# Altium project FG23_diff_PA_match.PrjPcb
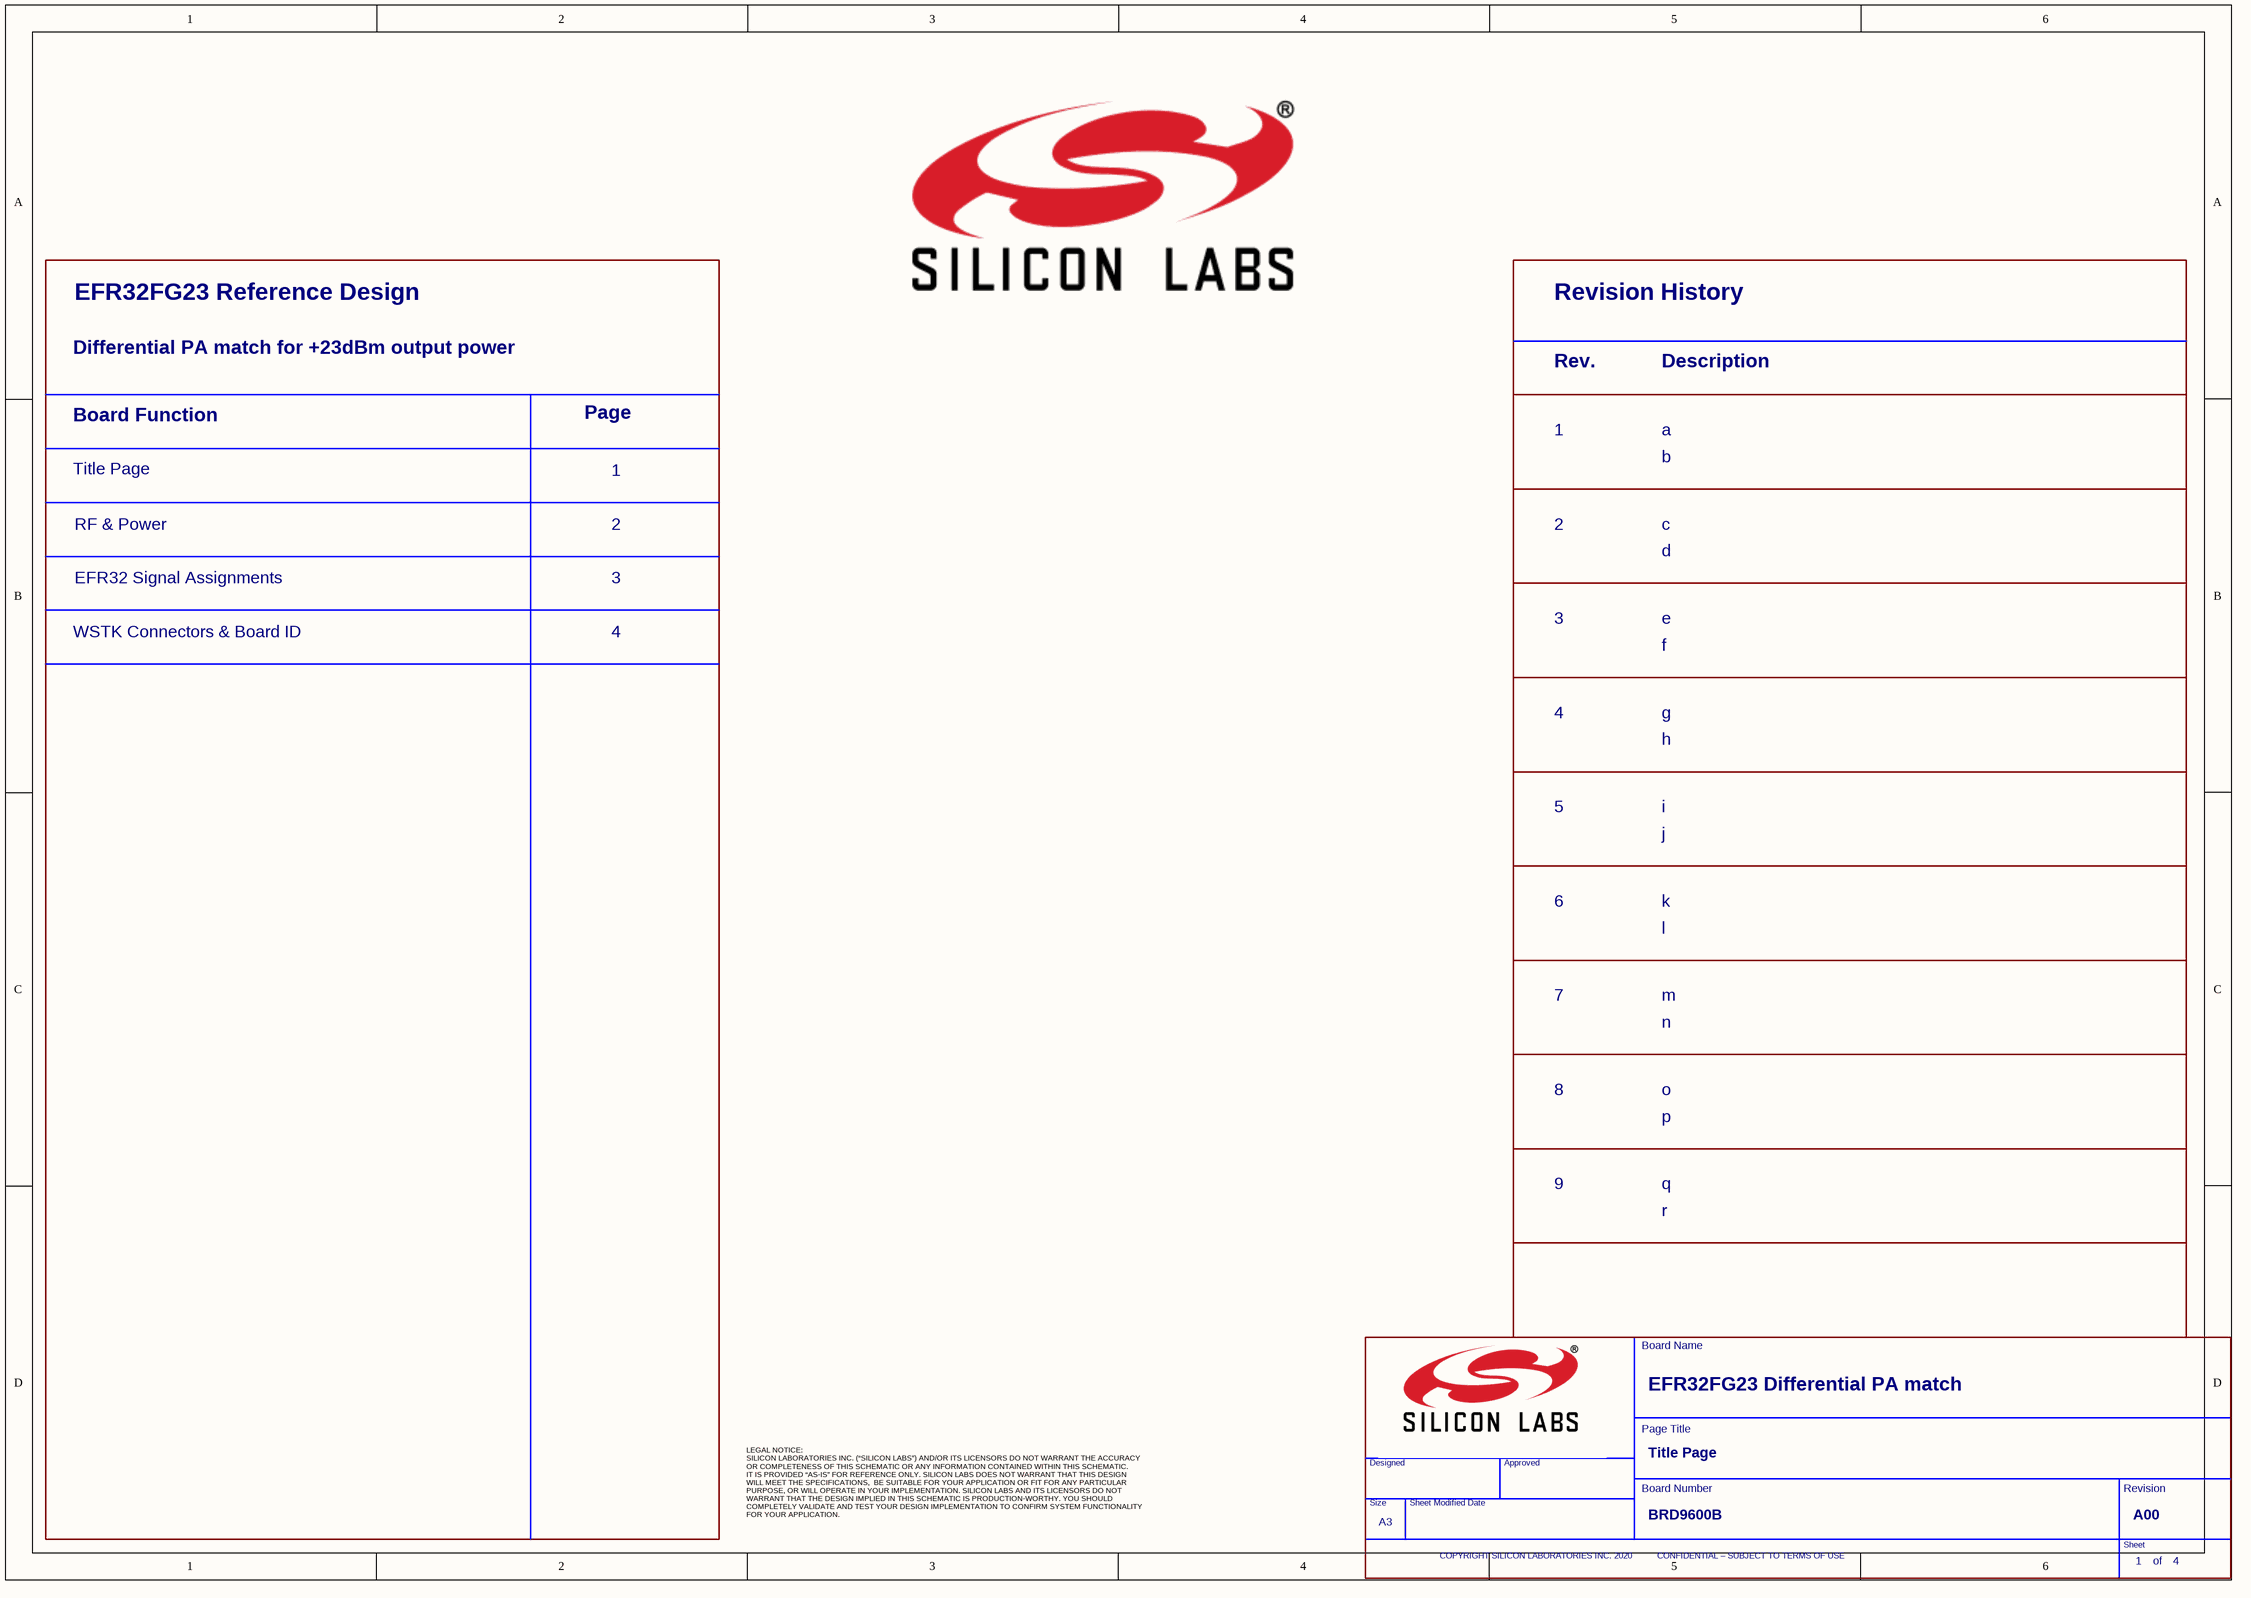
[diagram p0: FG23_diff_PA_match_SCH_Title.SchDoc]
4 sheets, 90 parts. Net scope: global (net labels, ports and power ports of the same name join across sheets).
Board files: FG23_diff_PA_match_PCB.PcbDoc, Ocelot_Test_panel.PcbDoc
Sheets:
  FG23_diff_PA_match_SCH_Title.SchDoc
  FG23_diff_PA_match_SCH_RF_Power.SchDoc
  FG23_diff_PA_match_SCH_Signal_Assign.SchDoc
  FG23_diff_PA_match_SCH_WSTK_Connectors.SchDoc

## Sheet FG23_diff_PA_match_SCH_Title.SchDoc
size 420 x 297 mm

### Parts
(Parts that share a designator on the sheet are numbered #1, #2 ... from top to bottom, then left to right.)
*#1  Header A: EFR32FG23 Reference Design  Header B: Differential PA match for +23dBm output power  (hidden comment: Toc_Header)  (graphical)
*#2  Dscr4B: h  Dscr5B: j  Dscr4A: g  Dscr6B: l  Dscr5A: i  Dscr7B: n  Dscr6A: k  Dscr8B: p  Dscr7A: m  Dscr9B: r  Dscr8A: o  Dscr9A: q  Dscr1B: b  Dscr2B: d  Dscr1A: a  Dscr3B: f  Dscr2A: c  Dscr3A: e  Rev9: 9  Rev8: 8  Rev7: 7  Rev6: 6  Rev5: 5  Rev4: 4  Rev3: 3  Rev2: 2  Rev1: 1  (hidden comment: Rev_History)  (graphical)
*#3  Doc: BRD9600B  RevCode: A00  Page Title: Title Page  Page Size: A3  Page Number: 1  Page Count: 4  Title: EFR32FG23 Differential PA match  (hidden comment: TitleBlock_SiliconLabs_A3)  (graphical)

### Notes on the sheet
- Board Function
- Page
- Title Page
- RF & Power
- 1
- 2
- EFR32 Signal Assignments
- 3
- WSTK Connectors & Board ID
- 4
- LEGAL NOTICE:
  SILICON LABORATORIES INC. (“SILICON LABS”) AND/OR ITS LICENSORS DO NOT WARRANT THE ACCURACY
  OR COMPLETENESS OF THIS SCHEMATIC OR ANY INFORMATION CONTAINED WITHIN THIS SCHEMATIC.
  IT IS PROVIDED “AS-IS” FOR REFERENCE ONLY. SILICON LABS DOES NOT WARRANT THAT THIS DESIGN
  WILL MEET THE SPECIFICATIONS,  BE SUITABLE FOR YOUR APPLICATION OR FIT FOR ANY PARTICULAR
  PURPOSE, OR WILL OPERATE IN YOUR IMPLEMENTATION. SILICON LABS AND ITS LICENSORS DO NOT
  WARRANT THAT THE DESIGN IMPLIED IN THIS SCHEMATIC IS PRODUCTION-WORTHY. YOU SHOULD
  COMPLETELY VALIDATE AND TEST YOUR DESIGN IMPLEMENTATION TO CONFIRM SYSTEM FUNCTIONALITY
  FOR YOUR APPLICATION.
- (in symbol Rev_History) Revision History; Rev.; Description
- (in symbol TitleBlock_SiliconLabs_A3) Board Name; Page Title; Designed; Approved; Board Number; Revision; Size; Sheet Modified Date; Sheet; COPYRIGHT SILICON LABORATORIES INC. 2020          CONFIDENTIAL – SUBJECT TO TERMS OF USE; of

### Library data of the parts
*#2 = Rev_History: RevCode: PA00*
*#3 = TitleBlock_SiliconLabs_A3: OrgName: Silicon Labs

## Sheet FG23_diff_PA_match_SCH_RF_Power.SchDoc
size 420 x 297 mm
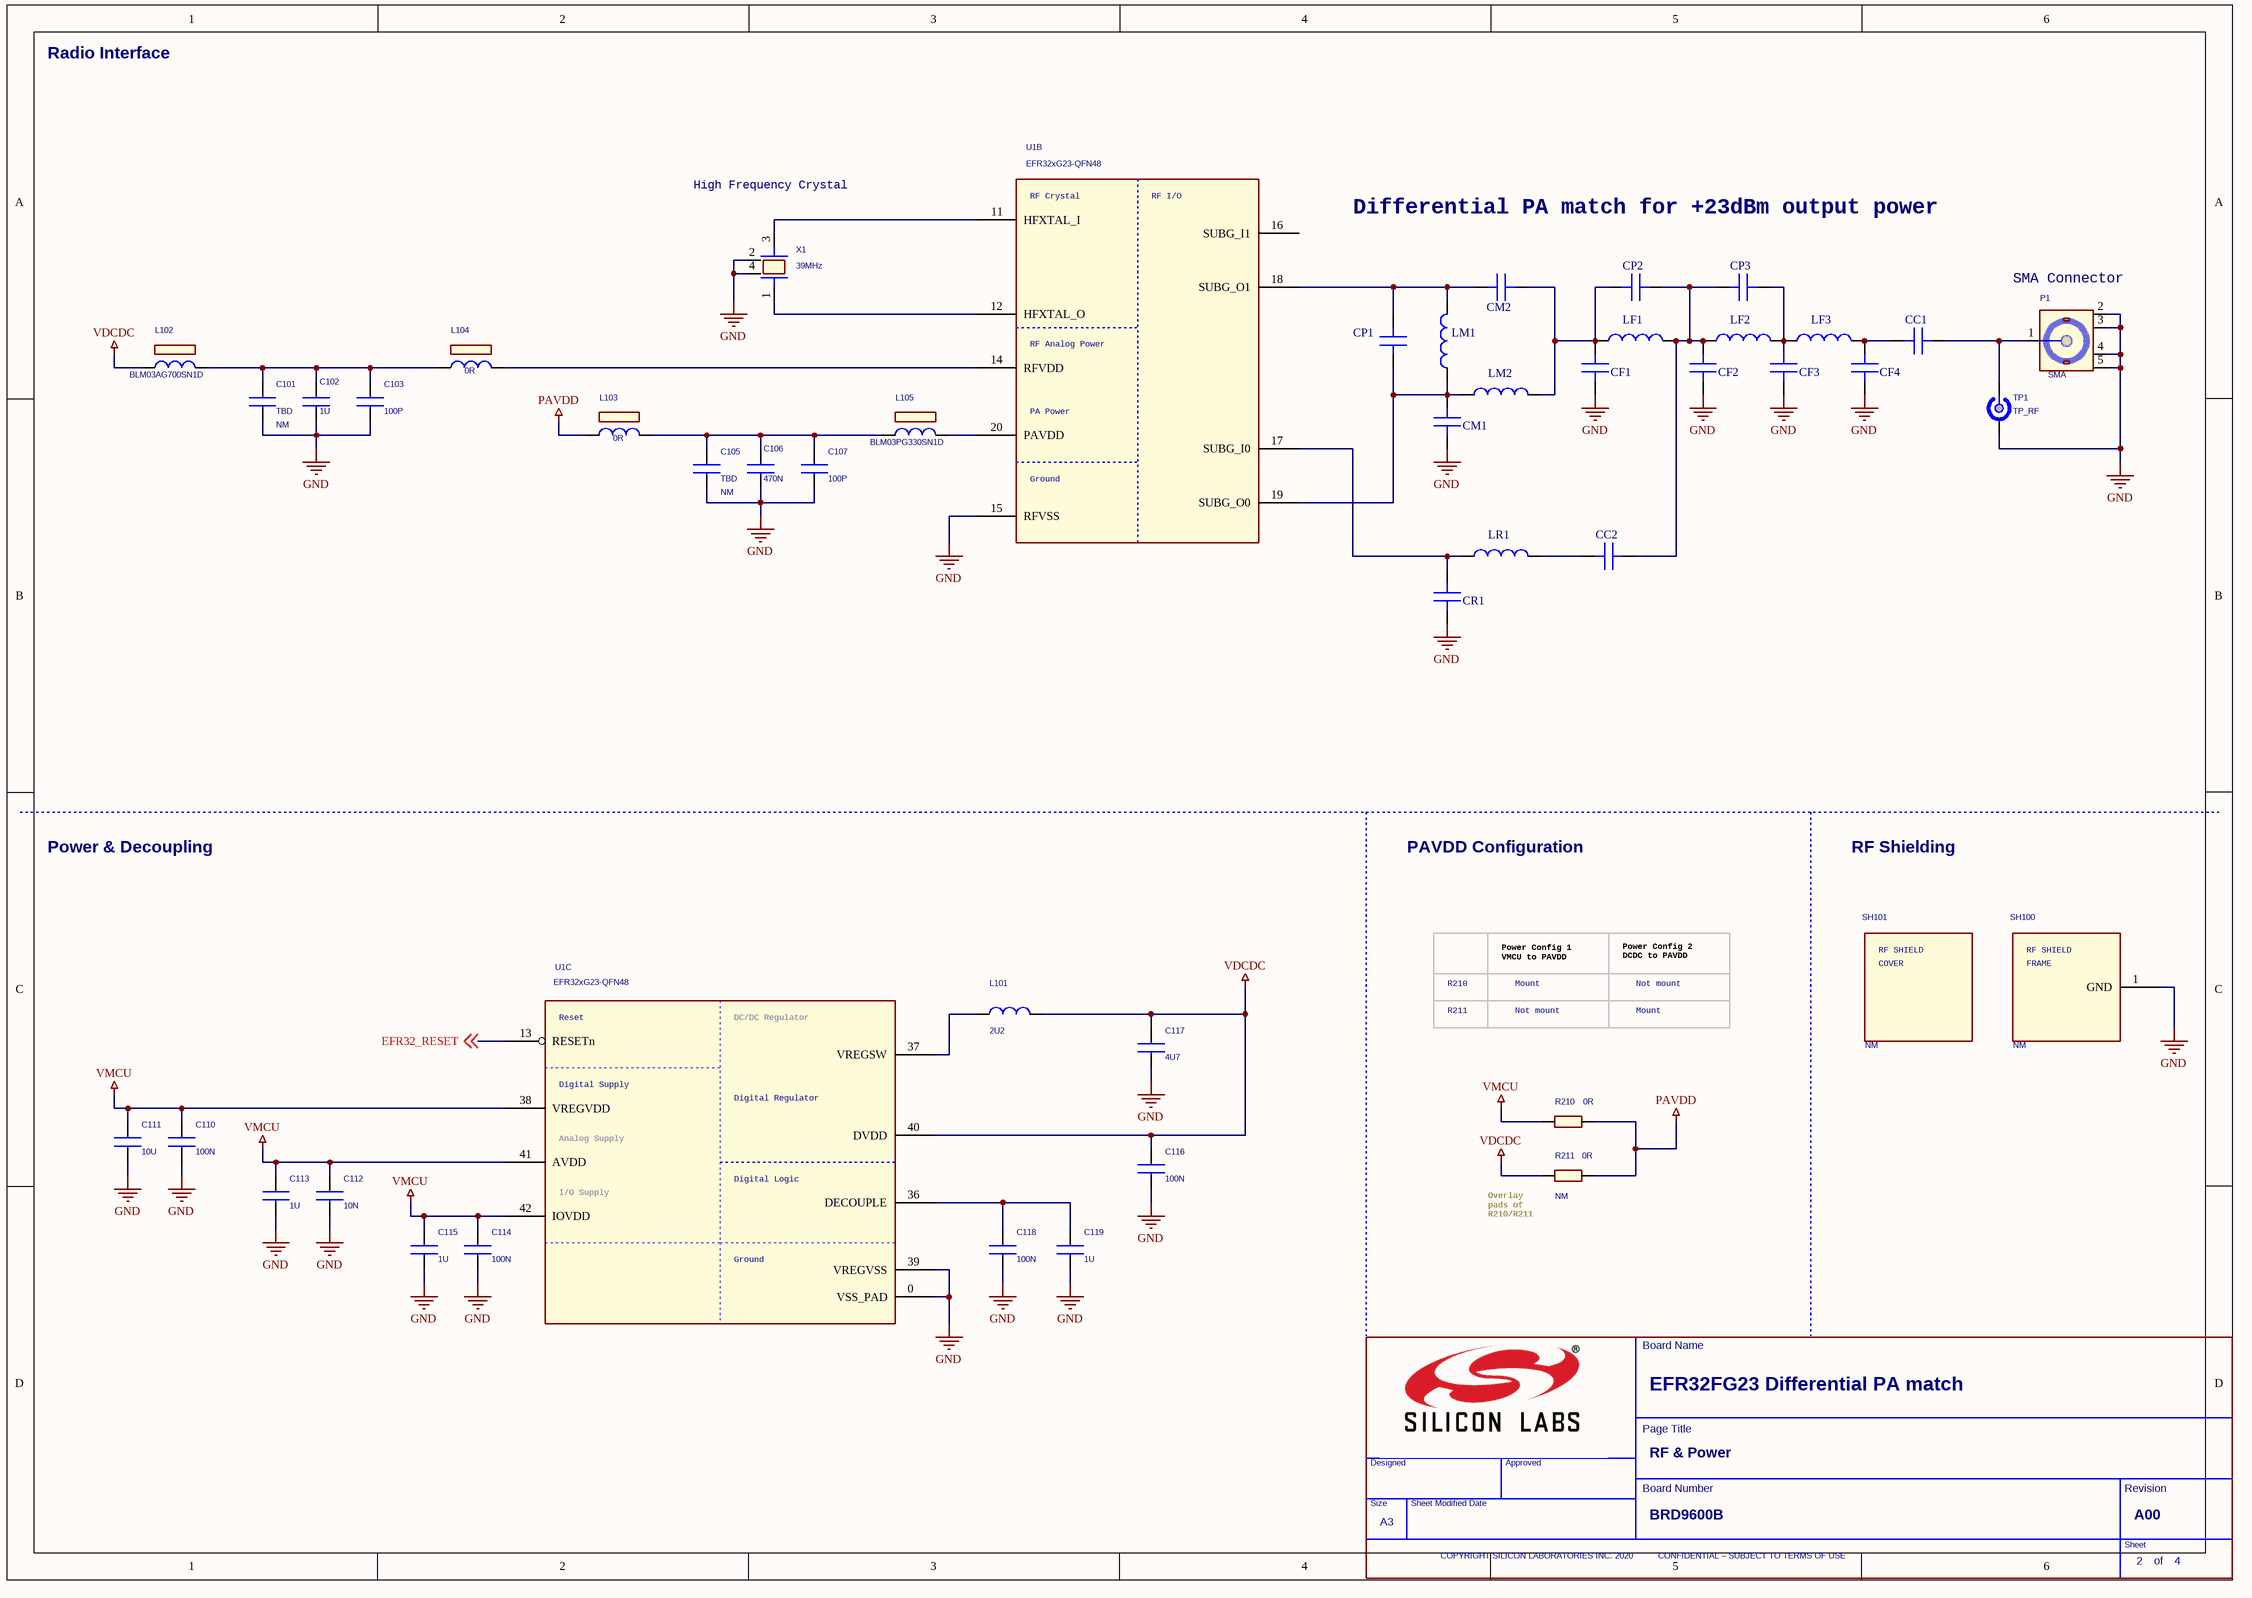
[diagram p1: FG23_diff_PA_match_SCH_RF_Power.SchDoc]

### Parts
(Parts that share a designator on the sheet are numbered #1, #2 ... from top to bottom, then left to right.)
*#4  Doc: BRD9600B  RevCode: A00  Page Title: RF & Power  Page Size: A3  Page Number: 2  Page Count: 4  Title: EFR32FG23 Differential PA match  (hidden comment: TitleBlock_SiliconLabs_A3)  (graphical)
C101  TBD  Not Mounted: NM  [C0201_L]
C102  1U  [C0402_L]
C103  100P  [C0201_L]
C105  TBD  Not Mounted: NM  [C0201_L]
C106  470N  [C0402_L]
C107  100P  [C0201_L]
C110  100N  [C0201_L]
C111  10U  [C0603_L]
C112  10N  [C0201_L]
C113  1U  [C0402_L]
C114  100N  [C0201_L]
C115  1U  [C0402_L]
C116  100N  [C0201_L]
C117  4U7  [C0603_L]
C118  100N  [C0201_L]
C119  1U  [C0402_L]
CC1  (no value)  [C0201_GM]
CC2  (no value)  [C0201_GM]
CF1  (no value)  [C0201_GM]
CF2  (no value)  [C0201_GM]
CF3  (no value)  [C0201_GM]
CF4  (no value)  [C0201_GM]
CM1  (no value)  [C0201_GM]
CM2  (no value)  [C0201_GM]
CP1  (no value)  [C0201_GM]
CP2  (no value)  [C0201_GM]
CP3  (no value)  [C0201_GM]
CR1  (no value)  [C0201_GM]
L101  2U2  [COIL_1008_L]
L102  BLM03AG700SN1D  [COIL_MUR_BLM03_0201]
L103  0R  [COIL_MUR_BLM03_0201]
L104  0R  [COIL_MUR_BLM03_0201]
L105  BLM03PG330SN1D  [COIL_MUR_BLM03_0201]
LF1  LQP03HQ3N6B02  [COIL_0201_GM]  (value not drawn)
LF2  LQP03HQ3N6B02  [COIL_0201_GM]  (value not drawn)
LF3  LQP03HQ3N6B02  [COIL_0201_GM]  (value not drawn)
LM1  LQP03HQ3N6B02  [COIL_0201_GM]  (value not drawn)
LM2  LQP03HQ3N6B02  [COIL_0201_GM]  (value not drawn)
LR1  LQP03HQ3N6B02  [COIL_0201_GM]  (value not drawn)
P1  SMA  [TE_SMA_1814832_TH_VER]
R210  0R  [R0402_L]
R211  0R  Not Mounted: NM  [R0402_L]
SH100  Not Mounted: NM  [Shield_21x21mm]  (hidden comment: RF_SHIELD_FRAME_36103205S)
SH101  Not Mounted: NM  (hidden comment: RF_SHIELD_COVER_36003200S)
TP1  TP_RF  [TP_INGUN_50OHM_PARTIAL]
U1  EFR32xG23-QFN48  [QFN48_M040_6.0X6.0_EP_SL]  (parts B,C of 3)
X1  39MHz  [X_SSS_DSX211SH_2.05X1.65-4]

### Nets
GND: C101.2 C102.2 C103.2 C105.2 C106.2 C107.2 C110.2 C111.2 C112.2 C113.2 C114.2 C115.2 C116.2 C117.2 C118.2 C119.2 CF1.1 CF2.1 CF3.1 CF4.1 CM1.1 CR1.1 P1.2(GND1) P1.3(GND2) P1.4(GND3) P1.5(GND4) SH100.1(GND) TP1.2(GND) U1.0(VSS_PAD) U1.15(RFVSS) U1.39(VREGVSS) X1.2 X1.4
PAVDD: L103.1 R210.1 R211.2
VDCDC: C116.1 C117.1 L101.2 L102.1 R211.1 U1.40(DVDD)
VMCU: C110.1 C111.1 C112.1 C113.1 C114.1 C115.1 R210.2 U1.38(VREGVDD) U1.41(AVDD) U1.42(IOVDD)
EFR32_RESET: U1.13(RESETn) ; off-sheet EFR32_RESET  [project net DBG_RESET]
NetC101_1: C101.1 C102.1 C103.1 L102.2 L104.1
NetC105_1: C105.1 C106.1 C107.1 L103.2 L105.1
NetC118_1: C118.1 C119.1 U1.36(DECOUPLE)
NetCC1_1: CC1.1 CF4.2 LF3.2
NetCC1_2: CC1.2 P1.1(SIGNAL) TP1.1(RF)
NetCC2_1: CC2.1 LR1.2
NetCC2_2: CC2.2 CF2.2 CP2.2 CP3.1 LF1.2 LF2.1
NetCF1_2: CF1.2 CM2.2 CP2.1 LF1.1 LM2.2
NetCF3_2: CF3.2 CP3.2 LF2.2 LF3.1
NetCM1_2: CM1.2 CP1.1 LM1.1 LM2.1 U1.19(SUBG_O0)
NetCM2_1: CM2.1 CP1.2 LM1.2 U1.18(SUBG_O1)
NetCR1_2: CR1.2 LR1.1 U1.17(SUBG_I0)
NetL101_1: L101.1 U1.37(VREGSW)
NetL104_2: L104.2 U1.14(RFVDD)
NetL105_2: L105.2 U1.20(PAVDD)
NetU1_11: U1.11(HFXTAL_I) X1.3
NetU1_12: U1.12(HFXTAL_O) X1.1

Not connected (* = marked no-connect by the designer): U1 16(SUBG_I1)

### Notes on the sheet
- Radio Interface
- High Frequency Crystal
- Differential PA match for +23dBm output power
- (near P1) SMA Connector
- Power & Decoupling
- PAVDD Configuration
- RF Shielding
- R210
- Power Config 1
  VMCU to PAVDD
- Mount
- Power Config 2
  DCDC to PAVDD
- Not mount
- R211
- (near R211) Overlay
  pads of
  R210/R211
- (in symbol EFR32xG23_QFN48, part B) RF Crystal; RF I/O; RF Analog Power; PA Power; Ground
- (in symbol EFR32xG23_QFN48, part C) Reset; DC/DC Regulator; Digital Supply; Digital Regulator; Analog Supply; Digital Logic; I/O Supply; Ground
- (in symbol RF_SHIELD_COVER_36003200S) RF SHIELD; COVER
- (in symbol RF_SHIELD_FRAME_36103205S) RF SHIELD; FRAME
- (in symbol TitleBlock_SiliconLabs_A3) Board Name; Page Title; Designed; Approved; Board Number; Revision; Size; Sheet Modified Date; Sheet; COPYRIGHT SILICON LABORATORIES INC. 2020          CONFIDENTIAL – SUBJECT TO TERMS OF USE; of

### Library data of the parts
C101 C105 = C0201: Tolerance: +/-0.05P; Rating: 50V; Technology: C0G
C102 C113 C115 C119 = C0402: Tolerance: 10%; Rating: 6.3V; Technology: X7R
C103 C107 = C0201: Tolerance: 5%; Rating: 25V; Technology: C0G
C106 = C0402: Tolerance: 10%; Rating: 10V; Technology: X7R
C110 C114 C116 C118 = C0201: Tolerance: 20%; Rating: 16V; Technology: X7S
C111 = C0603: Tolerance: 10%; Rating: 25V; Technology: X5R
C112 = C0201: Tolerance: 10%; Rating: 16V; Technology: X7S
C117 = C0603: Tolerance: 10%; Rating: 6.3V; Technology: X7R
CC1 CC2 = CMP-120-00593-A.01: CAP CER 0201 C0G 50V ±0.1pF; Manufacturer: Murata; Manufacturer PN: GJM0335C1H7R1BB01; Value: 220; SubCategory Tag: Ceramic; Min Operating Temp: -55°C; RoHS: Compliant; Material: C0G; Package: 0201; Tolerance: 0.1pF; Max Operating Temp: 125°C; Mount: SMD; Rating: 50V
CF1 CF4 = CMP-120-00593-A.01: CAP CER 0201 C0G 50V ±0.1pF; Manufacturer: Murata; Manufacturer PN: GJM0335C1H7R1BB01; Value: 15; SubCategory Tag: Ceramic; Min Operating Temp: -55°C; RoHS: Compliant; Material: C0G; Package: 0201; Tolerance: 0.1pF; Max Operating Temp: 125°C; Mount: SMD; Rating: 50V
CF2 CF3 = CMP-120-00593-A.01: CAP CER 0201 C0G 50V ±0.1pF; Manufacturer: Murata; Manufacturer PN: GJM0335C1H7R1BB01; Value: 30; SubCategory Tag: Ceramic; Min Operating Temp: -55°C; RoHS: Compliant; Material: C0G; Package: 0201; Tolerance: 0.1pF; Max Operating Temp: 125°C; Mount: SMD; Rating: 50V
CM1 = CMP-120-00593-A.01: CAP CER 0201 C0G 50V ±0.1pF; Manufacturer: Murata; Manufacturer PN: GJM0335C1H7R1BB01; Value: 82; SubCategory Tag: Ceramic; Min Operating Temp: -55°C; RoHS: Compliant; Material: C0G; Package: 0201; Tolerance: 0.1pF; Max Operating Temp: 125°C; Mount: SMD; Rating: 50V
CM2 = CMP-120-00593-A.01: CAP CER 0201 C0G 50V ±0.1pF; Manufacturer: Murata; Manufacturer PN: GJM0335C1H7R1BB01; Value: 43; SubCategory Tag: Ceramic; Min Operating Temp: -55°C; RoHS: Compliant; Material: C0G; Package: 0201; Tolerance: 0.1pF; Max Operating Temp: 125°C; Mount: SMD; Rating: 50V
CP1 = CMP-120-00593-A.01: CAP CER 0201 C0G 50V ±0.1pF; Manufacturer: Murata; Manufacturer PN: GJM0335C1H7R1BB01; Value: 27; SubCategory Tag: Ceramic; Min Operating Temp: -55°C; RoHS: Compliant; Material: C0G; Package: 0201; Tolerance: 0.1pF; Max Operating Temp: 125°C; Mount: SMD; Rating: 50V
CP2 CP3 = CMP-120-00593-A.01: CAP CER 0201 C0G 50V ±0.1pF; Manufacturer: Murata; Manufacturer PN: GJM0335C1H7R1BB01; Value: N.M.; SubCategory Tag: Ceramic; Min Operating Temp: -55°C; RoHS: Compliant; Material: C0G; Package: 0201; Tolerance: 0.1pF; Max Operating Temp: 125°C; Mount: SMD; Rating: 50V
CR1 = CMP-120-00593-A.01: CAP CER 0201 C0G 50V ±0.1pF; Manufacturer: Murata; Manufacturer PN: GJM0335C1H7R1BB01; Value: 2.6; SubCategory Tag: Ceramic; Min Operating Temp: -55°C; RoHS: Compliant; Material: C0G; Package: 0201; Tolerance: 0.1pF; Max Operating Temp: 125°C; Mount: SMD; Rating: 50V
L101 = L1008: Tolerance: +/-20%; Mfg #: DFE2HCAH2R2MJ0L; Mfg: Murata
L102 L105 = BLM03AX: Mfg: Murata; Price_1K: 0.05
  L102: Mfg #: BLM03AG700SN1D
  L105: Mfg #: BLM03PG330SN1D
L103 L104 = BLM03AX: Price_1K: 0.05
LF1 LF2 = CMP-155-00127-A.01: IND Fixed 0201 500mA 170mOhm ±0.1nH; Manufacturer: Murata; Value: 56; Shielding: Not shielded; DC Resistance: 0.17; Min Operating Temp: -55°C; Max Operating Temp: 125°C; Manufacturer PN: LQP03HQ3N6B02; RoHS: Compliant; SubCategory Tag: Fixed; Mount: SMD; Package: 0201; Tolerance: 0.1nH; Rating: 500mA
LF3 = CMP-155-00127-A.01: IND Fixed 0201 500mA 170mOhm ±0.1nH; Manufacturer: Murata; Value: 43; Shielding: Not shielded; DC Resistance: 0.17; Min Operating Temp: -55°C; Max Operating Temp: 125°C; Manufacturer PN: LQP03HQ3N6B02; RoHS: Compliant; SubCategory Tag: Fixed; Mount: SMD; Package: 0201; Tolerance: 0.1nH; Rating: 500mA
LM1 = CMP-155-00127-A.01: IND Fixed 0201 500mA 170mOhm ±0.1nH; Manufacturer: Murata; Value: 36; Shielding: Not shielded; DC Resistance: 0.17; Min Operating Temp: -55°C; Max Operating Temp: 125°C; Manufacturer PN: LQP03HQ3N6B02; RoHS: Compliant; SubCategory Tag: Fixed; Mount: SMD; Package: 0201; Tolerance: 0.1nH; Rating: 500mA
LM2 = CMP-155-00127-A.01: IND Fixed 0201 500mA 170mOhm ±0.1nH; Manufacturer: Murata; Value: 20; Shielding: Not shielded; DC Resistance: 0.17; Min Operating Temp: -55°C; Max Operating Temp: 125°C; Manufacturer PN: LQP03HQ3N6B02; RoHS: Compliant; SubCategory Tag: Fixed; Mount: SMD; Package: 0201; Tolerance: 0.1nH; Rating: 500mA
LR1 = CMP-155-00127-A.01: IND Fixed 0201 500mA 170mOhm ±0.1nH; Manufacturer: Murata; Value: 220; Shielding: Not shielded; DC Resistance: 0.17; Min Operating Temp: -55°C; Max Operating Temp: 125°C; Manufacturer PN: LQP03HQ3N6B02; RoHS: Compliant; SubCategory Tag: Fixed; Mount: SMD; Package: 0201; Tolerance: 0.1nH; Rating: 500mA
P1 = SMA_TH_WELLSHOW: Mfg #: C02AN31P00101; Price_1K: 1.46; Mfg: Wellshow
R210 R211 = R0402: Price_1K: 0.005
SH100 = RF_SHIELD_FRAME_36103205S: Mfg: Würth Elektronik; Mfg #: 36103205S; Price_1k: 1.00
SH101 = RF_SHIELD_COVER_36003200S: Mfg: Würth Elektronik; Mfg #: 36003200S; Price_1k: 0.944
U1 = EFR32xG23_QFN48: MFG: Silicon Labs; MFG #: EFR32xG23-QFN48
X1 = DSX211SH: Mfg #: TBD; Price_1K: 0.512; Mfg: TBD
*#4 = TitleBlock_SiliconLabs_A3: OrgName: Silicon Labs

## Sheet FG23_diff_PA_match_SCH_Signal_Assign.SchDoc
size 420 x 297 mm
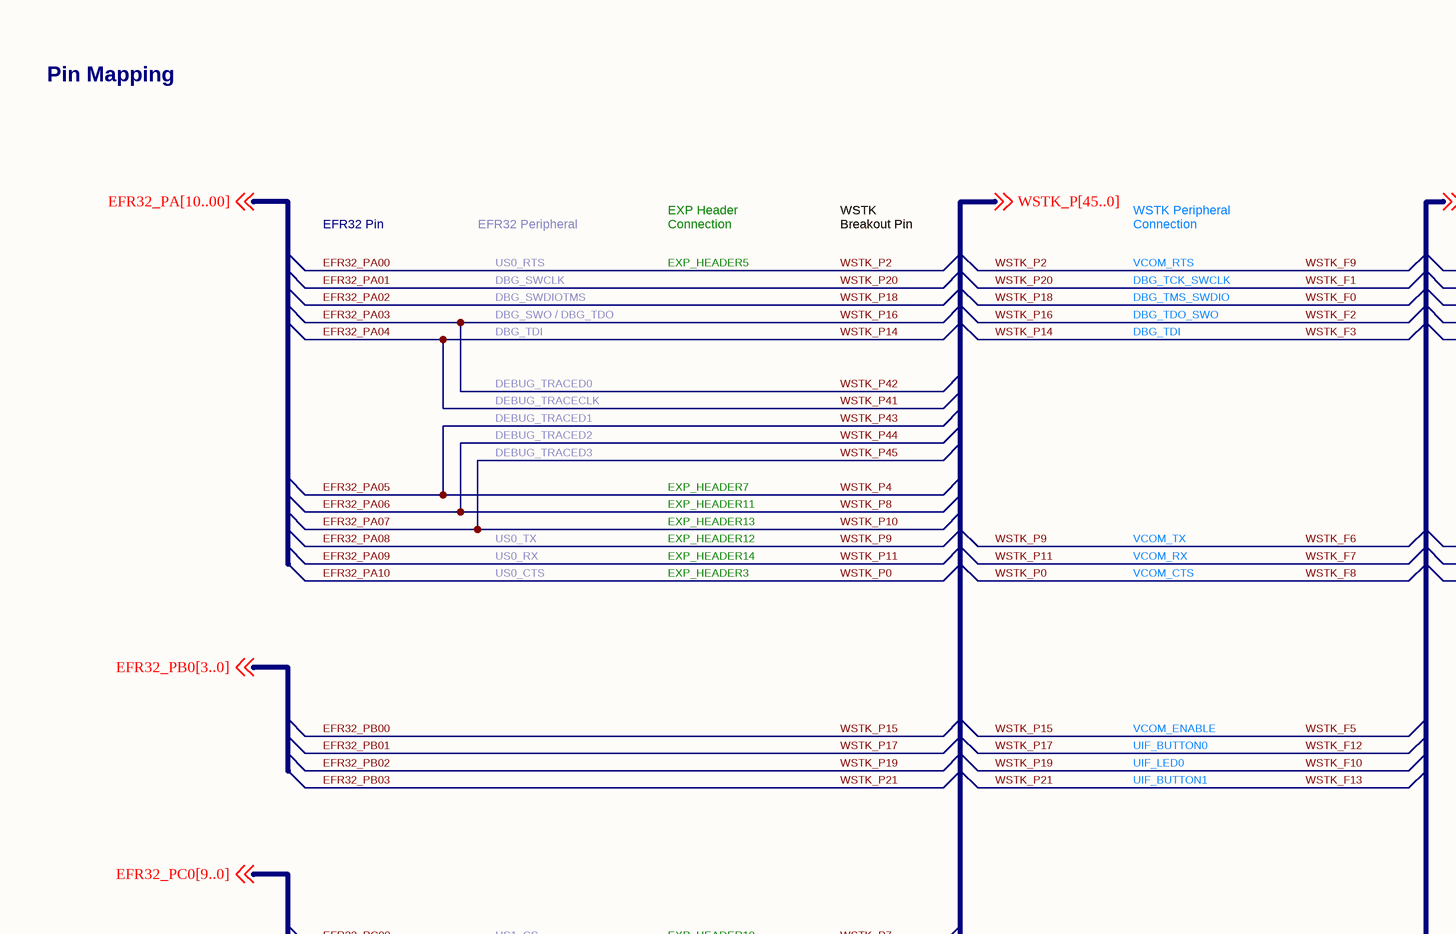
[diagram p2: FG23_diff_PA_match_SCH_Signal_Assign.SchDoc, top left]
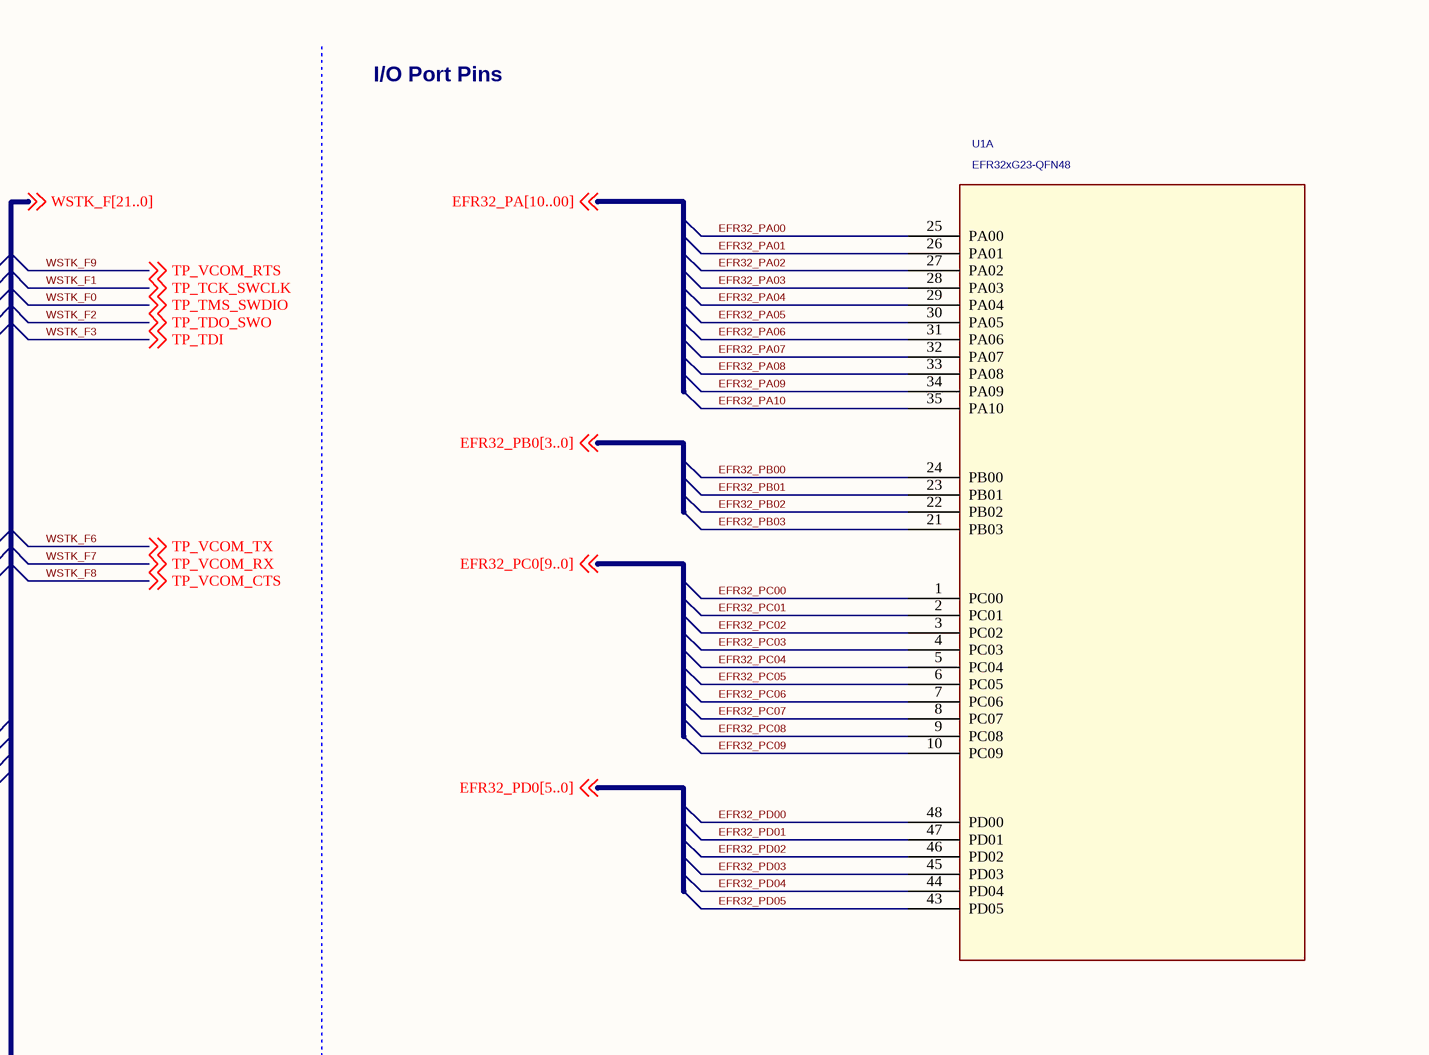
[diagram p3: FG23_diff_PA_match_SCH_Signal_Assign.SchDoc, top right]
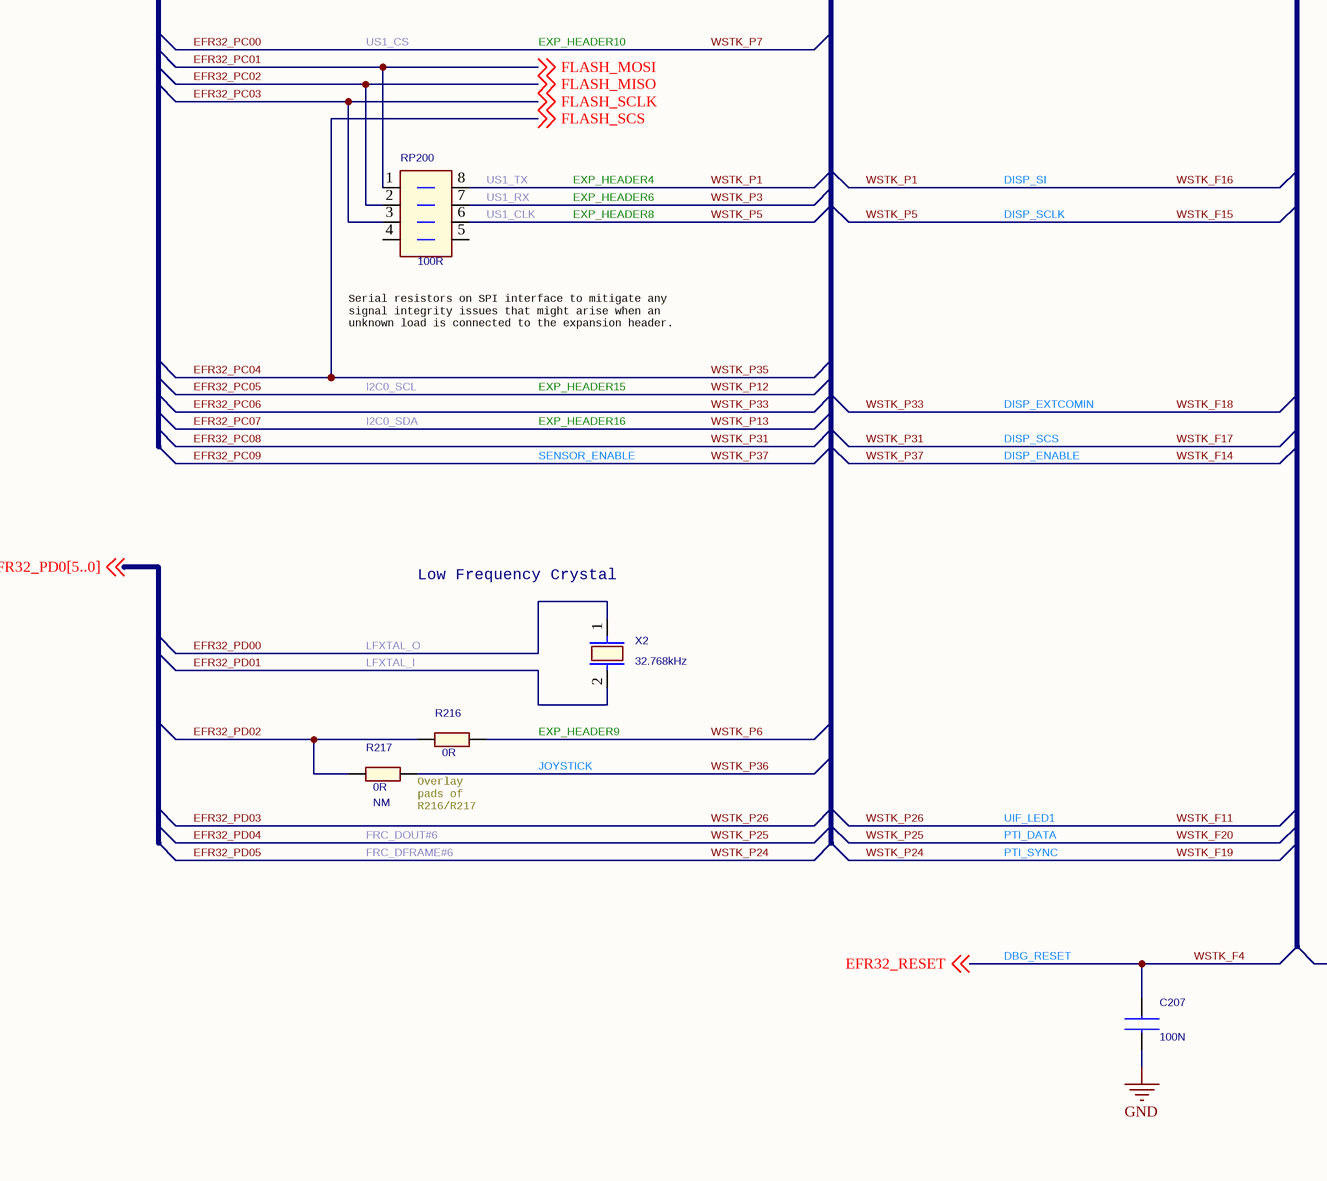
[diagram p4: FG23_diff_PA_match_SCH_Signal_Assign.SchDoc, bottom left]
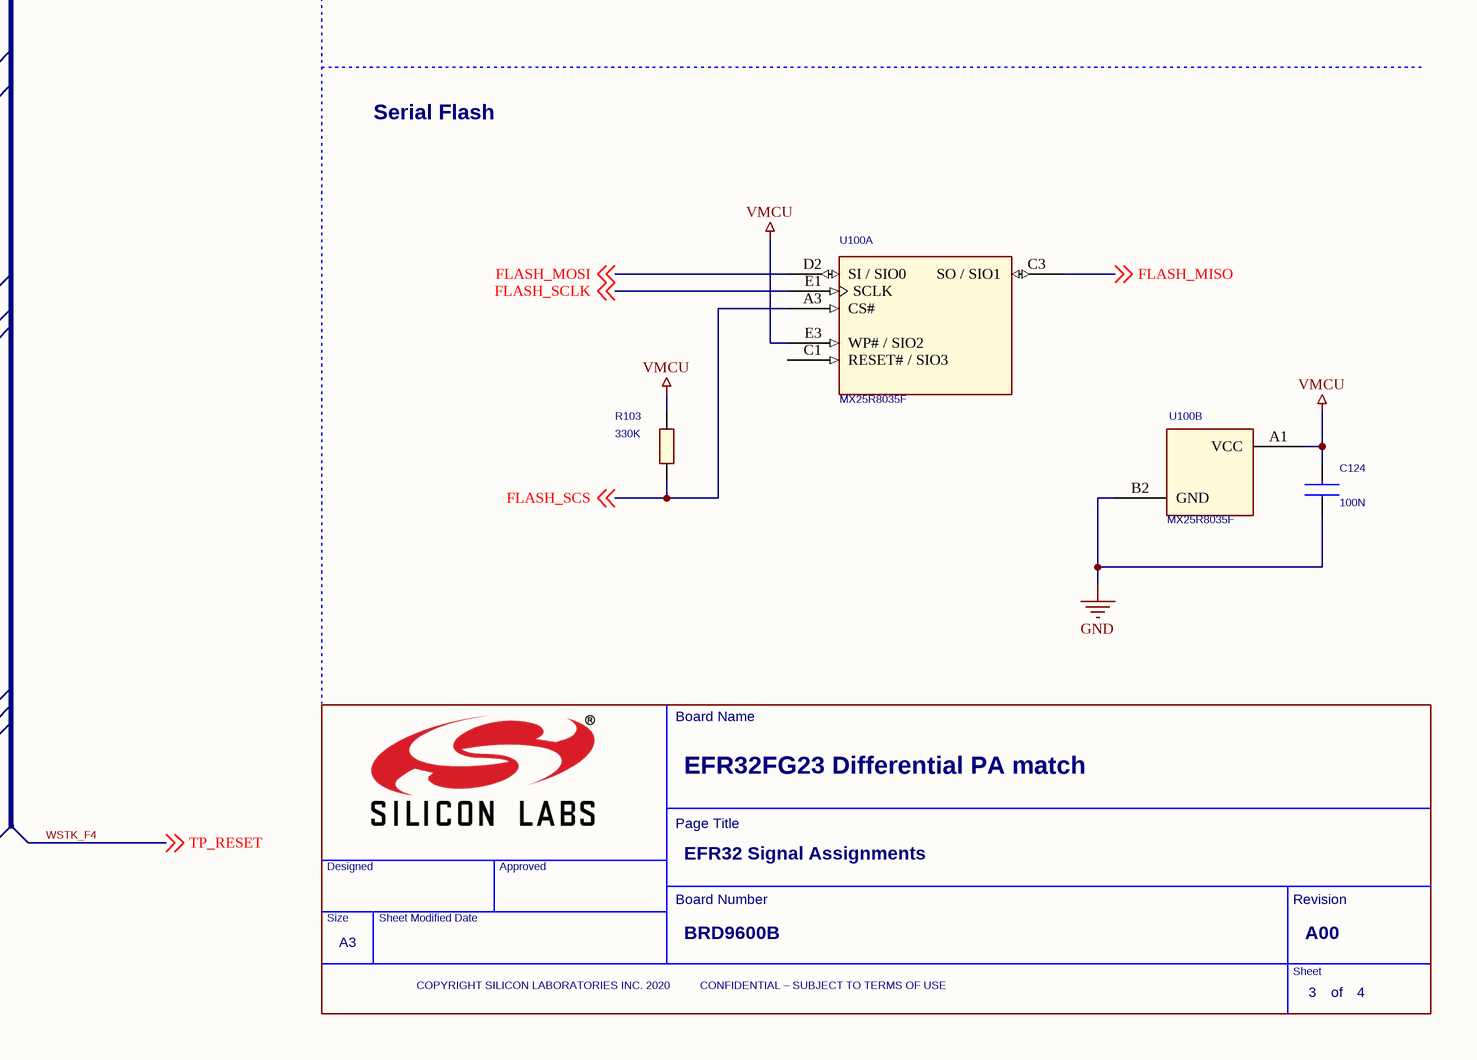
[diagram p5: FG23_diff_PA_match_SCH_Signal_Assign.SchDoc, bottom right]

### Parts
(Parts that share a designator on the sheet are numbered #1, #2 ... from top to bottom, then left to right.)
*#5  Doc: BRD9600B  RevCode: A00  Page Title: EFR32 Signal Assignments  Page Size: A3  Page Number: 3  Page Count: 4  Title: EFR32FG23 Differential PA match  (hidden comment: TitleBlock_SiliconLabs_A3)  (graphical)
C124  100N  [C0201_L]
C207  100N  [C0201_L]
R103  330K  [R0201_L]
R216  0R  [R0402_L]
R217  0R  Not Mounted: NM  [R0402_L]
RP200  100R  [RES_MNR04-8]
U1  EFR32xG23-QFN48  [QFN48_M040_6.0X6.0_EP_SL]  (part A of 3)
U100  MX25R8035F  [BGA8_M040_1.24x1.75_WLCSP]  (parts A,B of 2)
X2  32.768kHz  [X_MCS_CM8V-T1A]

### Nets
GND: C124.2 C207.2 U100.B2(GND)
VMCU: C124.1 R103.2 U100.A1(VCC) U100.E3(WP#_/_SIO2)
DBG_RESET: C207.1 ; off-sheet EFR32_RESET, off-sheet TP_RESET  [also labelled EFR32_RESET, TP_RESET, WSTK_F4]
DBG_SWCLK: U1.26(PA01) ; off-sheet TP_TCK_SWCLK  [also labelled DBG_TCK_SWCLK, EFR32_PA01, TP_TCK_SWCLK, WSTK_F1, WSTK_P20]
DBG_SWDIOTMS: U1.27(PA02) ; off-sheet TP_TMS_SWDIO  [also labelled DBG_TMS_SWDIO, EFR32_PA02, TP_TMS_SWDIO, WSTK_F0, WSTK_P18]
DBG_SWO / DBG_TDO: U1.28(PA03) ; off-sheet TP_TDO_SWO  [also labelled DBG_TDO_SWO, DEBUG_TRACED0, EFR32_PA03, TP_TDO_SWO, WSTK_F2, WSTK_P16, WSTK_P42]
DBG_TDI: U1.29(PA04) ; off-sheet TP_TDI  [also labelled DEBUG_TRACECLK, EFR32_PA04, TP_TDI, WSTK_F3, WSTK_P14, WSTK_P41]
DEBUG_TRACED1: U1.30(PA05)  [also labelled EFR32_PA05, EXP_HEADER7, WSTK_P4, WSTK_P43]
DEBUG_TRACED2: U1.31(PA06)  [also labelled EFR32_PA06, EXP_HEADER11, WSTK_P44, WSTK_P8]
DEBUG_TRACED3: U1.32(PA07)  [also labelled EFR32_PA07, EXP_HEADER13, WSTK_P10, WSTK_P45]
DISP_ENABLE: U1.10(PC09)  [also labelled EFR32_PC09, SENSOR_ENABLE, WSTK_F14, WSTK_P37]
DISP_EXTCOMIN: U1.7(PC06)  [also labelled EFR32_PC06, WSTK_F18, WSTK_P33]
DISP_SCLK: RP200.6(R16)  [also labelled EXP_HEADER8, US1_CLK, WSTK_F15, WSTK_P5]
DISP_SCS: U1.9(PC08)  [also labelled EFR32_PC08, WSTK_F17, WSTK_P31]
DISP_SI: RP200.8(R18)  [also labelled EXP_HEADER4, US1_TX, WSTK_F16, WSTK_P1]
EFR32_PA00: U1.25(PA00) ; off-sheet TP_VCOM_RTS  [also labelled EXP_HEADER5, TP_VCOM_RTS, US0_RTS, VCOM_RTS, WSTK_F9, WSTK_P2]
EFR32_PA08: U1.33(PA08) ; off-sheet TP_VCOM_TX  [also labelled EXP_HEADER12, TP_VCOM_TX, US0_TX, VCOM_TX, WSTK_F6, WSTK_P9]
EFR32_PA09: U1.34(PA09) ; off-sheet TP_VCOM_RX  [also labelled EXP_HEADER14, TP_VCOM_RX, US0_RX, VCOM_RX, WSTK_F7, WSTK_P11]
EFR32_PA10: U1.35(PA10) ; off-sheet TP_VCOM_CTS  [also labelled EXP_HEADER3, TP_VCOM_CTS, US0_CTS, VCOM_CTS, WSTK_F8, WSTK_P0]
EFR32_PB00: U1.24(PB00)  [also labelled VCOM_ENABLE, WSTK_F5, WSTK_P15]
EFR32_PB01: U1.23(PB01)  [also labelled UIF_BUTTON0, WSTK_F12, WSTK_P17]
EFR32_PB02: U1.22(PB02)  [also labelled UIF_LED0, WSTK_F10, WSTK_P19]
EFR32_PB03: U1.21(PB03)  [also labelled UIF_BUTTON1, WSTK_F13, WSTK_P21]
EFR32_PC00: U1.1(PC00)  [also labelled EXP_HEADER10, US1_CS, WSTK_P7]
EFR32_PC01: RP200.1(R11) U1.2(PC01) U100.D2(SI_/_SIO0) ; off-sheet FLASH_MOSI  [also labelled FLASH_MOSI]
EFR32_PC02: RP200.2(R12) U1.3(PC02) U100.C3(SO_/_SIO1) ; off-sheet FLASH_MISO  [also labelled FLASH_MISO]
EFR32_PC03: RP200.3(R13) U1.4(PC03) U100.E1(SCLK) ; off-sheet FLASH_SCLK  [also labelled FLASH_SCLK]
EFR32_PC04: R103.1 U1.5(PC04) U100.A3(CS#) ; off-sheet FLASH_SCS  [also labelled FLASH_SCS, WSTK_P35]
EFR32_PC05: U1.6(PC05)  [also labelled EXP_HEADER15, I2C0_SCL, WSTK_P12]
EFR32_PC07: U1.8(PC07)  [also labelled EXP_HEADER16, I2C0_SDA, WSTK_P13]
EFR32_PD00: U1.48(PD00) X2.1  [also labelled LFXTAL_O]
EFR32_PD01: U1.47(PD01) X2.2  [also labelled LFXTAL_I]
EFR32_PD02: R216.1 R217.1 U1.46(PD02)
EFR32_PD03: U1.45(PD03)  [also labelled UIF_LED1, WSTK_F11, WSTK_P26]
EFR32_PD04: U1.44(PD04)  [also labelled FRC_DOUT#6, PTI_DATA, WSTK_F20, WSTK_P25]
EFR32_PD05: U1.43(PD05)  [also labelled FRC_DFRAME#6, PTI_SYNC, WSTK_F19, WSTK_P24]
EXP_HEADER6: RP200.7(R17)  [also labelled US1_RX, WSTK_P3]
EXP_HEADER9: R216.2  [also labelled WSTK_P6]
JOYSTICK: R217.2  [also labelled WSTK_P36]

Not connected (* = marked no-connect by the designer): RP200 4(R14) 5(R15); U100 C1(RESET#_/_SIO3)

### Notes on the sheet
- Pin Mapping
- I/O Port Pins
- EFR32 Pin
- EFR32 Peripheral
- EXP Header
  Connection
- WSTK
  Breakout Pin
- WSTK Peripheral
  Connection
- Serial Flash
- (near RP200) Serial resistors on SPI interface to mitigate any
  signal integrity issues that might arise when an
  unknown load is connected to the expansion header.
- (near X2) Low Frequency Crystal
- (near R217) Overlay
  pads of
  R216/R217
- (in symbol TitleBlock_SiliconLabs_A3) Board Name; Page Title; Designed; Approved; Board Number; Revision; Size; Sheet Modified Date; Sheet; COPYRIGHT SILICON LABORATORIES INC. 2020          CONFIDENTIAL – SUBJECT TO TERMS OF USE; of

### Library data of the parts
C124 C207 = C0201: Tolerance: 20%; Rating: 16V; Technology: X7S
R103 = R0201: Price_1K: 0.005
R216 R217 = R0402: Price_1K: 0.005
RP200 = MNR04M0APJ101: Mfg: ROHM; Price_1K: 0.0122; Mfg #: MNR04M0APJ101
U1 = EFR32xG23_QFN48: MFG: Silicon Labs; MFG #: EFR32xG23-QFN48
U100 = MX25R8035: Mfg: Macronix; Mfg #: MX25R8035FBDIL0; Price_1K: 0.25
X2 = CM8V-T1A: Mfg: Micro Crystal AG; Mfg #: CM8V-T1A, 32768Hz, 12.5pF, +/- 20ppm; Price_1K: 0.3
*#5 = TitleBlock_SiliconLabs_A3: OrgName: Silicon Labs

## Sheet FG23_diff_PA_match_SCH_WSTK_Connectors.SchDoc
size 420 x 297 mm
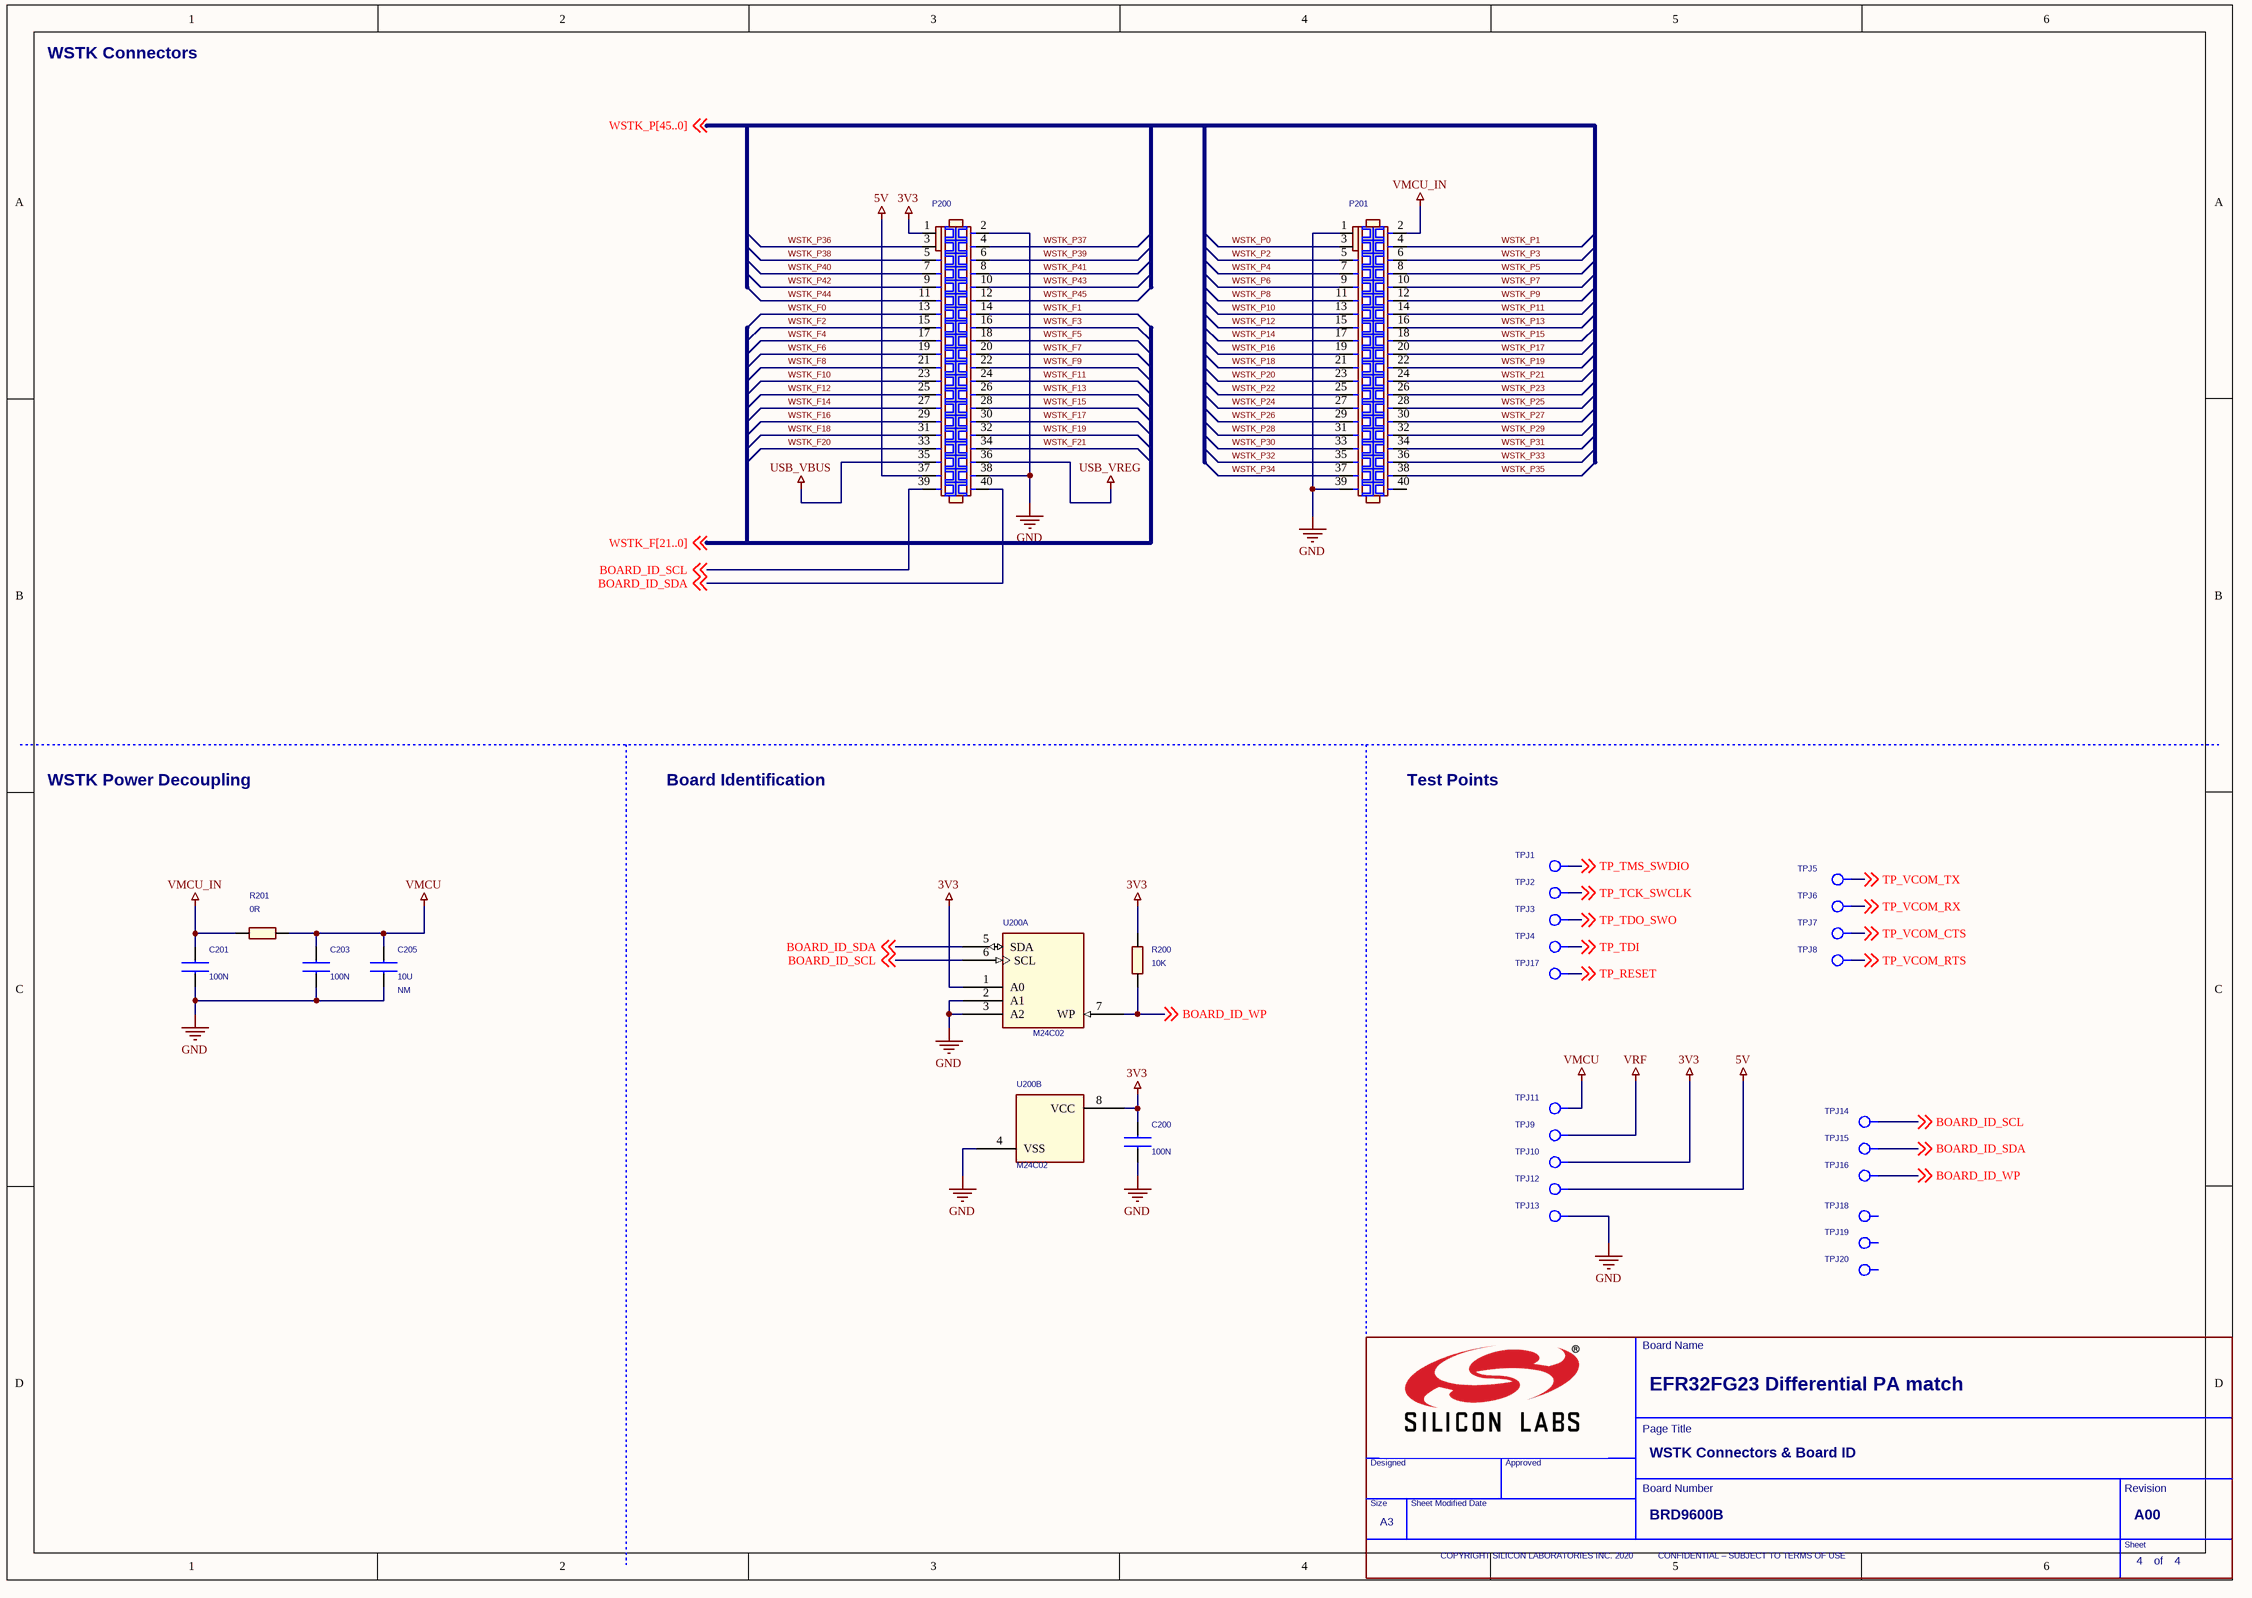
[diagram p6: FG23_diff_PA_match_SCH_WSTK_Connectors.SchDoc]

### Parts
(Parts that share a designator on the sheet are numbered #1, #2 ... from top to bottom, then left to right.)
*#6  Doc: BRD9600B  RevCode: A00  Page Title: WSTK Connectors & Board ID  Page Size: A3  Page Number: 4  Title: EFR32FG23 Differential PA match  (hidden comment: TitleBlock_SiliconLabs_A3)  (graphical)
C200  100N  [C0201_L]
C201  100N  [C0201_L]
C203  100N  [C0201_L]
C205  10U  Not Mounted: NM  [T_UNDEF]
P200  SOCKET_WCON_2X20_1.27MM_SMD  [SAM_SFC-120-T2-D-A-2X20_SNUM]  (value not drawn)
P201  SOCKET_WCON_2X20_1.27MM_SMD  [SAM_SFC-120-T2-D-A-2X20_SNUM]  (value not drawn)
R200  10K  [R0201_L]
R201  0R  [T_UNDEF]
TPJ1  TPJ_SMD  [TP_1.0_SMD]  (value not drawn)
TPJ2  TPJ_SMD  [TP_1.0_SMD]  (value not drawn)
TPJ3  TPJ_SMD  [TP_1.0_SMD]  (value not drawn)
TPJ4  TPJ_SMD  [TP_1.0_SMD]  (value not drawn)
TPJ5  TPJ_SMD  [TP_1.0_SMD]  (value not drawn)
TPJ6  TPJ_SMD  [TP_1.0_SMD]  (value not drawn)
TPJ7  TPJ_SMD  [TP_1.0_SMD]  (value not drawn)
TPJ8  TPJ_SMD  [TP_1.0_SMD]  (value not drawn)
TPJ9  TPJ_SMD  [TP1MM_SMD]  (value not drawn)
TPJ10  TPJ_SMD  [TP1MM_SMD]  (value not drawn)
TPJ11  TPJ_SMD  [TP1MM_SMD]  (value not drawn)
TPJ12  TPJ_SMD  [TP1MM_SMD]  (value not drawn)
TPJ13  TPJ_SMD  [TP1MM_SMD]  (value not drawn)
TPJ14  TPJ_SMD  [TP1MM_SMD]  (value not drawn)
TPJ15  TPJ_SMD  [TP1MM_SMD]  (value not drawn)
TPJ16  TPJ_SMD  [TP1MM_SMD]  (value not drawn)
TPJ17  TPJ_SMD  [TP_1.0_SMD]  (value not drawn)
TPJ18  TPJ_SMD  [TP1MM_SMD]  (value not drawn)
TPJ19  TPJ_SMD  [TP1MM_SMD]  (value not drawn)
TPJ20  TPJ_SMD  [TP1MM_SMD]  (value not drawn)
U200  M24C02  [TDFN8_M050_2.0X3.0_EP]  (parts A,B of 2)

### Nets
3V3: C200.1 P200.1 R200.2 TPJ10.1(TP) U200.1(A0) U200.8(VCC)
5V: P200.37 TPJ12.1(TP)
GND: C200.2 C201.2 C203.2 C205.2 P200.2 P200.38 P201.1 P201.39 TPJ13.1(TP) U200.2(A1) U200.3(A2) U200.4(VSS)
USB_VBUS: P200.35
USB_VREG: P200.36
VMCU: C203.1 C205.1 R201.2 TPJ11.1(TP)
VMCU_IN: C201.1 P201.2 R201.1
VRF: TPJ9.1(TP)
BOARD_ID_SCL: P200.39 TPJ14.1(TP) U200.6(SCL) ; off-sheet BOARD_ID_SCL
BOARD_ID_SDA: P200.40 TPJ15.1(TP) U200.5(SDA) ; off-sheet BOARD_ID_SDA
BOARD_ID_WP: R200.1 TPJ16.1(TP) U200.7(WP) ; off-sheet BOARD_ID_WP
TP_RESET: P200.17 TPJ17.1(TP) ; off-sheet TP_RESET  [also labelled WSTK_F4]  [project net DBG_RESET]
TP_TCK_SWCLK: P200.14 P201.23 TPJ2.1(TP) ; off-sheet TP_TCK_SWCLK  [also labelled WSTK_F1, WSTK_P20]  [project net DBG_SWCLK]
TP_TDI: P200.8 P200.16 P201.17 TPJ4.1(TP) ; off-sheet TP_TDI  [also labelled WSTK_F3, WSTK_P14, WSTK_P41]  [project net DBG_TDI]
TP_TDO_SWO: P200.9 P200.15 P201.19 TPJ3.1(TP) ; off-sheet TP_TDO_SWO  [also labelled WSTK_F2, WSTK_P16, WSTK_P42]  [project net DBG_SWO / DBG_TDO]
TP_TMS_SWDIO: P200.13 P201.21 TPJ1.1(TP) ; off-sheet TP_TMS_SWDIO  [also labelled WSTK_F0, WSTK_P18]  [project net DBG_SWDIOTMS]
TP_VCOM_CTS: P200.21 P201.3 TPJ7.1(TP) ; off-sheet TP_VCOM_CTS  [also labelled WSTK_F8, WSTK_P0]  [project net EFR32_PA10]
TP_VCOM_RTS: P200.22 P201.5 TPJ8.1(TP) ; off-sheet TP_VCOM_RTS  [also labelled WSTK_F9, WSTK_P2]  [project net EFR32_PA00]
TP_VCOM_RX: P200.20 P201.14 TPJ6.1(TP) ; off-sheet TP_VCOM_RX  [also labelled WSTK_F7, WSTK_P11]  [project net EFR32_PA09]
TP_VCOM_TX: P200.19 P201.12 TPJ5.1(TP) ; off-sheet TP_VCOM_TX  [also labelled WSTK_F6, WSTK_P9]  [project net EFR32_PA08]
WSTK_F5: P200.18 P201.18  [also labelled WSTK_P15]  [project net EFR32_PB00]
WSTK_F10: P200.23 P201.22  [also labelled WSTK_P19]  [project net EFR32_PB02]
WSTK_F11: P200.24 P201.29  [also labelled WSTK_P26]  [project net EFR32_PD03]
WSTK_F12: P200.25 P201.20  [also labelled WSTK_P17]  [project net EFR32_PB01]
WSTK_F13: P200.26 P201.24  [also labelled WSTK_P21]  [project net EFR32_PB03]
WSTK_F14: P200.4 P200.27  [also labelled WSTK_P37]  [project net DISP_ENABLE]
WSTK_F15: P200.28 P201.8  [also labelled WSTK_P5]  [project net DISP_SCLK]
WSTK_F16: P200.29 P201.4  [also labelled WSTK_P1]  [project net DISP_SI]
WSTK_F17: P200.30 P201.34  [also labelled WSTK_P31]  [project net DISP_SCS]
WSTK_F18: P200.31 P201.36  [also labelled WSTK_P33]  [project net DISP_EXTCOMIN]
WSTK_F19: P200.32 P201.27  [also labelled WSTK_P24]  [project net EFR32_PD05]
WSTK_F20: P200.33 P201.28  [also labelled WSTK_P25]  [project net EFR32_PD04]
WSTK_F21: P200.34
WSTK_P3: P201.6  [project net EXP_HEADER6]
WSTK_P4: P200.10 P201.7  [also labelled WSTK_P43]  [project net DEBUG_TRACED1]
WSTK_P6: P201.9  [project net EXP_HEADER9]
WSTK_P7: P201.10  [project net EFR32_PC00]
WSTK_P10: P200.12 P201.13  [also labelled WSTK_P45]  [project net DEBUG_TRACED3]
WSTK_P12: P201.15  [project net EFR32_PC05]
WSTK_P13: P201.16  [project net EFR32_PC07]
WSTK_P22: P201.25
WSTK_P23: P201.26
WSTK_P27: P201.30
WSTK_P28: P201.31
WSTK_P29: P201.32
WSTK_P30: P201.33
WSTK_P32: P201.35
WSTK_P34: P201.37
WSTK_P35: P201.38  [project net EFR32_PC04]
WSTK_P36: P200.3  [project net JOYSTICK]
WSTK_P38: P200.5
WSTK_P39: P200.6
WSTK_P40: P200.7
WSTK_P44: P200.11 P201.11  [also labelled WSTK_P8]  [project net DEBUG_TRACED2]

Not connected (* = marked no-connect by the designer): P201 40; TPJ18 1(TP); TPJ19 1(TP); TPJ20 1(TP)

### Notes on the sheet
- WSTK Connectors
- WSTK Power Decoupling
- Board Identification
- Test Points
- (in symbol TitleBlock_SiliconLabs_A3) Board Name; Page Title; Designed; Approved; Board Number; Revision; Size; Sheet Modified Date; Sheet; COPYRIGHT SILICON LABORATORIES INC. 2020          CONFIDENTIAL – SUBJECT TO TERMS OF USE; of

### Library data of the parts
C200 C201 C203 = C0201: Tolerance: 20%; Rating: 16V; Technology: X7S
C205 = CAPACITOR: Technology: X5R
P200 P201 = SOCKET_WCON_2X20_1.27MM_SMD: Mfg #: 2344-220MS3CUNR6; Mfg: WCON; Price_1K: 3.44
R200 = R0201: Price_1K: 0.005
R201 = RESISTOR: Price_1K: 0.005
TPJ1-TPJ8 TPJ17 = TPJ_SMD_Dup1
U200 = M24C02: Mfg: ST Microelectronics; Mfg #: M24C02-FMC6TG; CONTEC Footprint: MSOP8_M065_W3.0; Price_1K: 0.06
*#6 = TitleBlock_SiliconLabs_A3: Page Count: 4; OrgName: Silicon Labs

## Nets that join several sheets
GND: FG23_diff_PA_match_SCH_RF_Power (33 pins), FG23_diff_PA_match_SCH_Signal_Assign (C124.2 C207.2 U100.B2), FG23_diff_PA_match_SCH_WSTK_Connectors (12 pins)
VMCU: FG23_diff_PA_match_SCH_RF_Power (10 pins), FG23_diff_PA_match_SCH_Signal_Assign (C124.1 R103.2 U100.A1 U100.E3), FG23_diff_PA_match_SCH_WSTK_Connectors (C203.1 C205.1 R201.2 TPJ11.1)
DBG_RESET: FG23_diff_PA_match_SCH_RF_Power (U1.13), FG23_diff_PA_match_SCH_Signal_Assign (C207.1), FG23_diff_PA_match_SCH_WSTK_Connectors (P200.17 TPJ17.1)
DBG_SWCLK: FG23_diff_PA_match_SCH_Signal_Assign (U1.26), FG23_diff_PA_match_SCH_WSTK_Connectors (P200.14 P201.23 TPJ2.1)
DBG_SWDIOTMS: FG23_diff_PA_match_SCH_Signal_Assign (U1.27), FG23_diff_PA_match_SCH_WSTK_Connectors (P200.13 P201.21 TPJ1.1)
DBG_SWO / DBG_TDO: FG23_diff_PA_match_SCH_Signal_Assign (U1.28), FG23_diff_PA_match_SCH_WSTK_Connectors (P200.9 P200.15 P201.19 TPJ3.1)
DBG_TDI: FG23_diff_PA_match_SCH_Signal_Assign (U1.29), FG23_diff_PA_match_SCH_WSTK_Connectors (P200.8 P200.16 P201.17 TPJ4.1)
DEBUG_TRACED1: FG23_diff_PA_match_SCH_Signal_Assign (U1.30), FG23_diff_PA_match_SCH_WSTK_Connectors (P200.10 P201.7)
DEBUG_TRACED2: FG23_diff_PA_match_SCH_Signal_Assign (U1.31), FG23_diff_PA_match_SCH_WSTK_Connectors (P200.11 P201.11)
DEBUG_TRACED3: FG23_diff_PA_match_SCH_Signal_Assign (U1.32), FG23_diff_PA_match_SCH_WSTK_Connectors (P200.12 P201.13)
DISP_ENABLE: FG23_diff_PA_match_SCH_Signal_Assign (U1.10), FG23_diff_PA_match_SCH_WSTK_Connectors (P200.4 P200.27)
DISP_EXTCOMIN: FG23_diff_PA_match_SCH_Signal_Assign (U1.7), FG23_diff_PA_match_SCH_WSTK_Connectors (P200.31 P201.36)
DISP_SCLK: FG23_diff_PA_match_SCH_Signal_Assign (RP200.6), FG23_diff_PA_match_SCH_WSTK_Connectors (P200.28 P201.8)
DISP_SCS: FG23_diff_PA_match_SCH_Signal_Assign (U1.9), FG23_diff_PA_match_SCH_WSTK_Connectors (P200.30 P201.34)
DISP_SI: FG23_diff_PA_match_SCH_Signal_Assign (RP200.8), FG23_diff_PA_match_SCH_WSTK_Connectors (P200.29 P201.4)
EFR32_PA00: FG23_diff_PA_match_SCH_Signal_Assign (U1.25), FG23_diff_PA_match_SCH_WSTK_Connectors (P200.22 P201.5 TPJ8.1)
EFR32_PA08: FG23_diff_PA_match_SCH_Signal_Assign (U1.33), FG23_diff_PA_match_SCH_WSTK_Connectors (P200.19 P201.12 TPJ5.1)
EFR32_PA09: FG23_diff_PA_match_SCH_Signal_Assign (U1.34), FG23_diff_PA_match_SCH_WSTK_Connectors (P200.20 P201.14 TPJ6.1)
EFR32_PA10: FG23_diff_PA_match_SCH_Signal_Assign (U1.35), FG23_diff_PA_match_SCH_WSTK_Connectors (P200.21 P201.3 TPJ7.1)
EFR32_PB00: FG23_diff_PA_match_SCH_Signal_Assign (U1.24), FG23_diff_PA_match_SCH_WSTK_Connectors (P200.18 P201.18)
EFR32_PB01: FG23_diff_PA_match_SCH_Signal_Assign (U1.23), FG23_diff_PA_match_SCH_WSTK_Connectors (P200.25 P201.20)
EFR32_PB02: FG23_diff_PA_match_SCH_Signal_Assign (U1.22), FG23_diff_PA_match_SCH_WSTK_Connectors (P200.23 P201.22)
EFR32_PB03: FG23_diff_PA_match_SCH_Signal_Assign (U1.21), FG23_diff_PA_match_SCH_WSTK_Connectors (P200.26 P201.24)
EFR32_PC00: FG23_diff_PA_match_SCH_Signal_Assign (U1.1), FG23_diff_PA_match_SCH_WSTK_Connectors (P201.10)
EFR32_PC04: FG23_diff_PA_match_SCH_Signal_Assign (R103.1 U1.5 U100.A3), FG23_diff_PA_match_SCH_WSTK_Connectors (P201.38)
EFR32_PC05: FG23_diff_PA_match_SCH_Signal_Assign (U1.6), FG23_diff_PA_match_SCH_WSTK_Connectors (P201.15)
EFR32_PC07: FG23_diff_PA_match_SCH_Signal_Assign (U1.8), FG23_diff_PA_match_SCH_WSTK_Connectors (P201.16)
EFR32_PD03: FG23_diff_PA_match_SCH_Signal_Assign (U1.45), FG23_diff_PA_match_SCH_WSTK_Connectors (P200.24 P201.29)
EFR32_PD04: FG23_diff_PA_match_SCH_Signal_Assign (U1.44), FG23_diff_PA_match_SCH_WSTK_Connectors (P200.33 P201.28)
EFR32_PD05: FG23_diff_PA_match_SCH_Signal_Assign (U1.43), FG23_diff_PA_match_SCH_WSTK_Connectors (P200.32 P201.27)
EXP_HEADER6: FG23_diff_PA_match_SCH_Signal_Assign (RP200.7), FG23_diff_PA_match_SCH_WSTK_Connectors (P201.6)
EXP_HEADER9: FG23_diff_PA_match_SCH_Signal_Assign (R216.2), FG23_diff_PA_match_SCH_WSTK_Connectors (P201.9)
JOYSTICK: FG23_diff_PA_match_SCH_Signal_Assign (R217.2), FG23_diff_PA_match_SCH_WSTK_Connectors (P200.3)

## Assembly variants
Variant of BRD4263Z: all parts fitted